# Altium schematic sheet Buzzer.SchDoc
size A; SheetNumber: 4; SheetTotal: 5
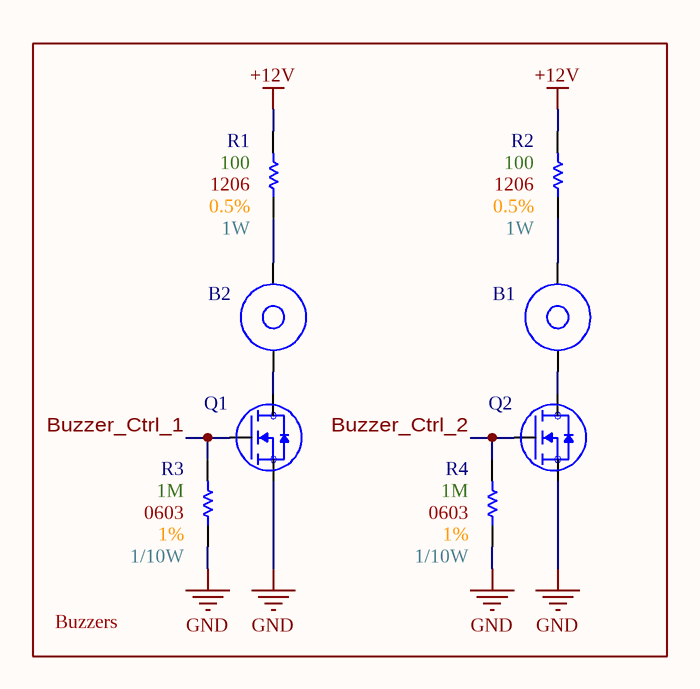
[diagram p0: Buzzer.SchDoc]

## Parts
B1  Passive buzzer  [[Buzzer] Passive SMD 12V 80mA]  (value not drawn)
B2  Passive buzzer  [[Buzzer] Passive SMD 12V 80mA]  (value not drawn)
Q1  [NMOS] SMD 20V 1.4A 160mOhm  [SOT323]  (value not drawn)
Q2  [NMOS] SMD 20V 1.4A 160mOhm  [SOT323]  (value not drawn)
R1  Wattage: 1W  Tolerance: 0.5%  Resistance: 100  Size Package: 1206  [[Res] SMD 1206]  (hidden comment: [100] SMD 1206 0.5% 1W)
R2  Wattage: 1W  Tolerance: 0.5%  Resistance: 100  Size Package: 1206  [[Res] SMD 1206]  (hidden comment: [100] SMD 1206 0.5% 1W)
R3  Wattage: 1/10W  Tolerance: 1%  Resistance: 1M  Size Package: 0603  [[Res] SMD 0603]  (hidden comment: [1M] SMD 0603 1% 1/10W)
R4  Wattage: 1/10W  Tolerance: 1%  Resistance: 1M  Size Package: 0603  [[Res] SMD 0603]  (hidden comment: [1M] SMD 0603 1% 1/10W)

## Blocks framed on the sheet
Buzzers: B1 B2 Q1 Q2 R1-R4

## Nets
+12V: R1.2 R2.2
GND: Q1.2(Source) Q2.2(Source) R3.1 R4.1
Buzzer_Ctrl_1: Q1.1(Gate) R3.2
Buzzer_Ctrl_2: Q2.1(Gate) R4.2
NetB1_1: B1.1(+) R2.1
NetB1_2: B1.2(-) Q2.3(Drain)
NetB2_1: B2.1(+) R1.1
NetB2_2: B2.2(-) Q1.3(Drain)

## Library data of the parts
B1 B2 = [Buzzer] Passive SMD 12V 80mA: CT08E-16S400-2; Supplier 1: DigiKey; Supplier Part Number 1: 2603-CT08E-16S400-2CT-ND
Q1 Q2 = [NMOS] SMD 20V 1.4A 160mOhm: BSS816NWH6327XTSA1; Supplier 1: DigiKey; Supplier Part Number 1: BSS816NWH6327XTSA1CT-ND
R1 R2 = [100] SMD 1206 0.5% 1W: HRG3216P-1000-D-T1; Supplier 1: DigiKey; Supplier Part Number 1: 408-1865-1-ND
R3 R4 = [1M] SMD 0603 1% 1/10W: RC0603FR-071ML; Supplier 1: DigiKey; Supplier Part Number 1: 311-1.00MHRDKR-ND